# Altium schematic sheet AudioControlSystem.SchDoc
size 406 x 241 mm; SheetNumber: 1; SheetTotal: 7
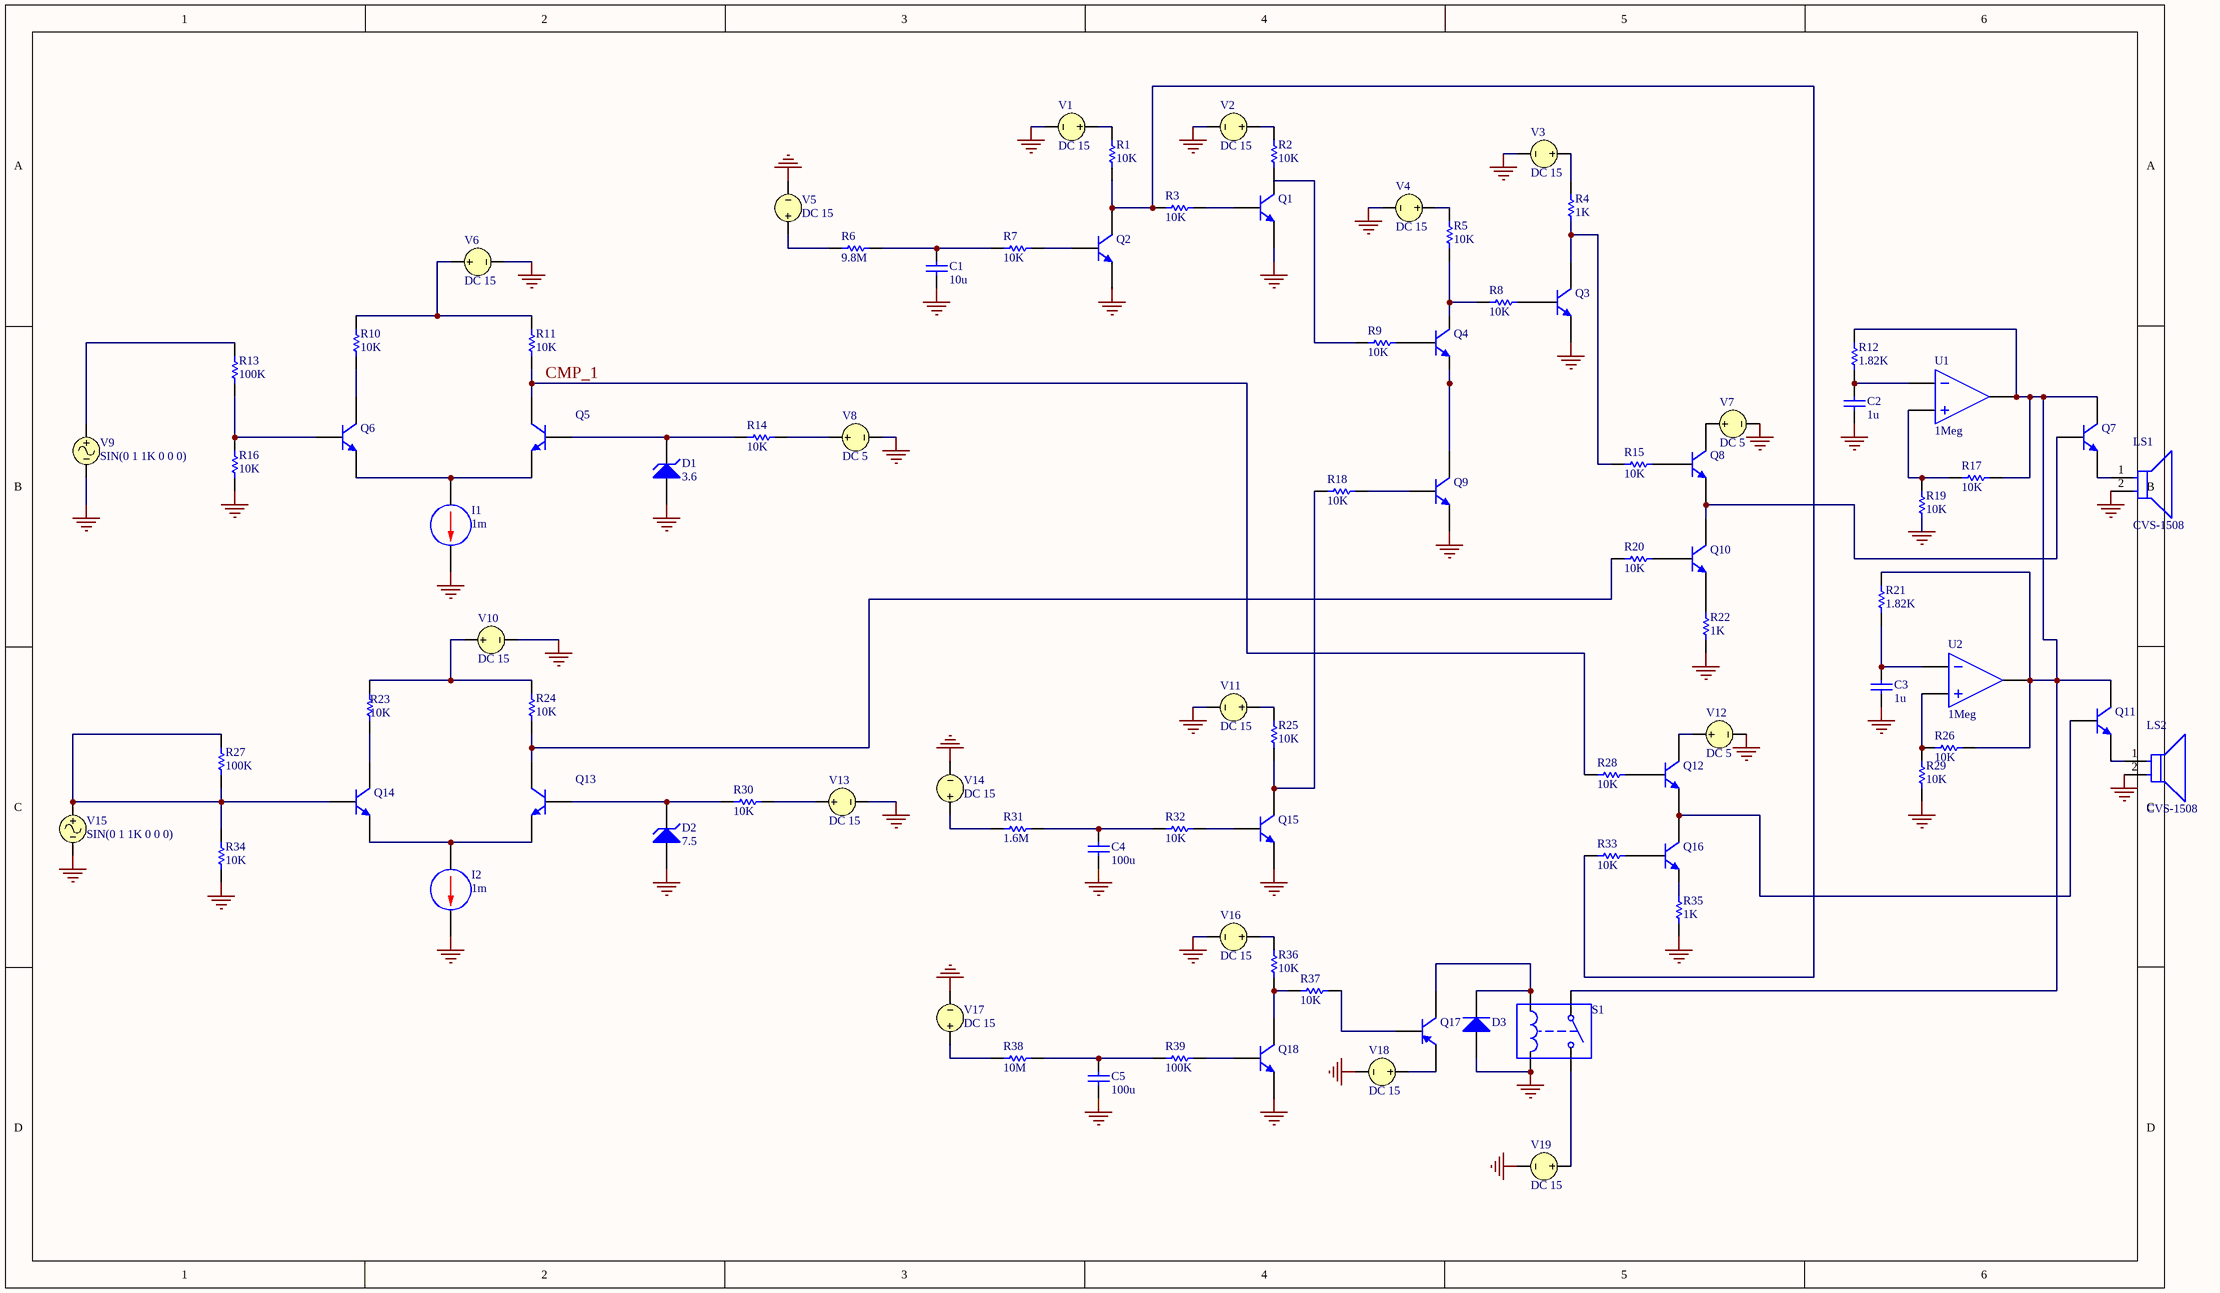
[diagram p0: AudioControlSystem.SchDoc]

## Parts
C1  value 10u  (hidden comment: Capacitor)
C2  value 1u  (hidden comment: Capacitor)
C3  value 1u  (hidden comment: Capacitor)
C4  value 100u  (hidden comment: Capacitor)
C5  value 100u  (hidden comment: Capacitor)
D1  BV: 3.6  (hidden comment: Zener Diode)
D2  BV: 7.5  (hidden comment: Zener Diode)
D3  Diode  (value not drawn)
I1  DC: 1m  (hidden comment: DC Current Source)
I2  DC: 1m  (hidden comment: DC Current Source)
LS1  CVS-1508  [FP-CVS-1508-MFG]
LS2  CVS-1508  [FP-CVS-1508-MFG]
Q1  Bipolar NPN 3 Pins Transistor VBIC Model  (value not drawn)
Q2  Bipolar NPN 3 Pins Transistor VBIC Model  (value not drawn)
Q3  Bipolar NPN 3 Pins Transistor VBIC Model  (value not drawn)
Q4  Bipolar NPN 3 Pins Transistor Gummel-Poon Model  (value not drawn)
Q5  Bipolar NPN 3 Pins Transistor Modified Version of the Gummel-Poon Model  (value not drawn)
Q6  Bipolar NPN 3 Pins Transistor Modified Version of the Gummel-Poon Model  (value not drawn)
Q7  Bipolar NPN 3 Pins Transistor VBIC Model  (value not drawn)
Q8  Bipolar NPN 3 Pins Transistor VBIC Model  (value not drawn)
Q9  Bipolar NPN 3 Pins Transistor Gummel-Poon Model  (value not drawn)
Q10  Bipolar NPN 3 Pins Transistor VBIC Model  (value not drawn)
Q11  Bipolar NPN 3 Pins Transistor VBIC Model  (value not drawn)
Q12  Bipolar NPN 3 Pins Transistor VBIC Model  (value not drawn)
Q13  Bipolar NPN 3 Pins Transistor Modified Version of the Gummel-Poon Model  (value not drawn)
Q14  Bipolar NPN 3 Pins Transistor Modified Version of the Gummel-Poon Model  (value not drawn)
Q15  Bipolar NPN 3 Pins Transistor VBIC Model  (value not drawn)
Q16  Bipolar NPN 3 Pins Transistor VBIC Model  (value not drawn)
Q17  Bipolar PNP 3 Pins Transistor VBIC Model  (value not drawn)
Q18  Bipolar NPN 3 Pins Transistor VBIC Model  (value not drawn)
R1  value 10K  (hidden comment: Resistor)
R2  value 10K  (hidden comment: Resistor)
R3  value 10K  (hidden comment: Resistor)
R4  value 1K  (hidden comment: Resistor)
R5  value 10K  (hidden comment: Resistor)
R6  value 9.8M  (hidden comment: Resistor)
R7  value 10K  (hidden comment: Resistor)
R8  value 10K  (hidden comment: Resistor)
R9  value 10K  (hidden comment: Resistor)
R10  value 10K  (hidden comment: Resistor)
R11  value 10K  (hidden comment: Resistor)
R12  value 1.82K  (hidden comment: Resistor)
R13  value 100K  (hidden comment: Resistor)
R14  value 10K  (hidden comment: Resistor)
R15  value 10K  (hidden comment: Resistor)
R16  value 10K  (hidden comment: Resistor)
R17  value 10K  (hidden comment: Resistor)
R18  value 10K  (hidden comment: Resistor)
R19  value 10K  (hidden comment: Resistor)
R20  value 10K  (hidden comment: Resistor)
R21  value 1.82K  (hidden comment: Resistor)
R22  value 1K  (hidden comment: Resistor)
R23  value 10K  (hidden comment: Resistor)
R24  value 10K  (hidden comment: Resistor)
R25  value 10K  (hidden comment: Resistor)
R26  value 10K  (hidden comment: Resistor)
R27  value 100K  (hidden comment: Resistor)
R28  value 10K  (hidden comment: Resistor)
R29  value 10K  (hidden comment: Resistor)
R30  value 10K  (hidden comment: Resistor)
R31  value 1.6M  (hidden comment: Resistor)
R32  value 10K  (hidden comment: Resistor)
R33  value 10K  (hidden comment: Resistor)
R34  value 10K  (hidden comment: Resistor)
R35  value 1K  (hidden comment: Resistor)
R36  value 10K  (hidden comment: Resistor)
R37  value 10K  (hidden comment: Resistor)
R38  value 10M  (hidden comment: Resistor)
R39  value 100K  (hidden comment: Resistor)
S1  Single-Pole, Single-Throw Normally Opened Relay  (value not drawn)
U1  GAIN: 1Meg  (hidden comment: Ideal Operational Amplifier)
U2  GAIN: 1Meg  (hidden comment: Ideal Operational Amplifier)
V1  DC 15
V2  DC 15
V3  DC 15
V4  DC 15
V5  DC 15
V6  DC 15
V7  DC 5
V8  DC 5
V9  SIN(0 1 1K 0 0 0)
V10  DC 15
V11  DC 15
V12  DC 5
V13  DC 15
V14  DC 15
V15  SIN(0 1 1K 0 0 0)
V16  DC 15
V17  DC 15
V18  DC 15
V19  DC 15

## Nets
GND: C1.1 C2.1 C3.1 C4.1 C5.1 D1.1(A) D2.1(A) D3.1(A) I1.1(+) I2.1(+) LS1.2(A) LS2.2(A) Q1.3(E) Q2.3(E) Q3.3(E) Q9.3(E) Q15.3(E) Q18.3(E) R16.1 R19.1 R22.1 R29.1 R34.1 R35.1 S1.4 V1.2 V2.2 V3.2 V4.2 V5.2 V6.2 V7.2 V8.2 V9.2 V10.2 V11.2 V12.2 V13.2 V14.2 V15.2 V16.2 V17.2 V18.2 V19.2
CMP_1: Q5.1(C) R11.1 R28.1
NetC1_2: C1.2 R6.2 R7.1
NetC2_2: C2.2 R12.1 U1.1(IN-)
NetC3_2: C3.2 R21.1 U2.1(IN-)
NetC4_2: C4.2 R31.2 R32.1
NetC5_2: C5.2 R38.2 R39.1
NetD1_2: D1.2(K) Q5.2(B) R14.1
NetD2_2: D2.2(K) Q13.2(B) R30.1
NetD3_2: D3.2(K) Q17.1(C) S1.3
NetI1_2: I1.2(-) Q5.3(E) Q6.3(E)
NetI2_2: I2.2(-) Q13.3(E) Q14.3(E)
NetLS1_1: LS1.1(C) Q7.3(E)
NetLS2_1: LS2.1(C) Q11.3(E)
NetQ1_2: Q1.2(B) R3.2
NetQ2_1: Q2.1(C) R1.1 R3.1 R33.1
NetQ2_2: Q2.2(B) R7.2
NetQ3_1: Q3.1(C) R4.1 R15.1
NetQ3_2: Q3.2(B) R8.2
NetQ4_1: Q4.1(C) R5.1 R8.1
NetQ4_2: Q4.2(B) R9.2
NetQ4_3: Q4.3(E) Q9.1(C)
NetQ6_1: Q6.1(C) R10.1
NetQ6_2: Q6.2(B) R13.1 R16.2
NetQ7_1: Q7.1(C) Q11.1(C) R12.2 R17.1 R21.2 R26.1 S1.1 U1.3(OUT) U2.3(OUT)
NetQ7_2: Q7.2(B) Q8.3(E) Q10.1(C)
NetQ8_1: Q8.1(C) V7.1
NetQ8_2: Q8.2(B) R15.2
NetQ9_2: Q9.2(B) R18.2
NetQ10_2: Q10.2(B) R20.2
NetQ10_3: Q10.3(E) R22.2
NetQ11_2: Q11.2(B) Q12.3(E) Q16.1(C)
NetQ12_1: Q12.1(C) V12.1
NetQ12_2: Q12.2(B) R28.2
NetQ13_1: Q13.1(C) R20.1 R24.1
NetQ14_1: Q14.1(C) R23.1
NetQ14_2: Q14.2(B) R27.1 R27.2 R34.2 V15.1
NetQ15_1: Q15.1(C) R18.1 R25.1
NetQ15_2: Q15.2(B) R32.2
NetQ16_2: Q16.2(B) R33.2
NetQ16_3: Q16.3(E) R35.2
NetQ17_2: Q17.2(B) R37.2
NetQ17_3: Q17.3(E) V18.1
NetQ18_1: Q18.1(C) R36.1 R37.1
NetQ18_2: Q18.2(B) R39.2
NetR1_2: R1.2 V1.1
NetR2_1: R2.1 R9.1
NetR2_2: R2.2 V2.1
NetR4_2: R4.2 V3.1
NetR5_2: R5.2 V4.1
NetR6_1: R6.1 V5.1
NetR10_2: R10.2 R11.2 V6.1
NetR13_2: R13.2 V9.1
NetR14_2: R14.2 V8.1
NetR17_2: R17.2 R19.2 U1.2(IN+)
NetR23_2: R23.2 R24.2 V10.1
NetR25_2: R25.2 V11.1
NetR26_2: R26.2 R29.2 U2.2(IN+)
NetR30_2: R30.2 V13.1
NetR31_1: R31.1 V14.1
NetR36_2: R36.2 V16.1
NetR38_1: R38.1 V17.1
NetS1_2: S1.2 V19.1

Not connected (* = marked no-connect by the designer): Q1 1(C)

## Library data of the parts
C1-C5 = Capacitor: SimulationGenericComponent: True
D1 D2 = Zener Diode: AF: 1; BV_MAX: 1e99; CJO: 0; EG: 1.11; FC: 0.5; IBV: 0.001; IS: 1e-14; MJSW: 0.33; NTUN: 30; TNOM: 27; XTI: 3; SimulationGenericComponent: True; CJP: 0; CTA: 0; CTP: 0; FCS: 0.5; FV_MAX: 1e99; IKF: 0; IKR: 0; ISR: 1e-14; JSW: 0; JTUN: 0; JTUNSW: 0; KEG: 1; KF: 0; LEVEL: 1; N: 1; NBV: 1; NR: 1; NS: 1; PHP: 1; RS: 0; TCV: 0; TLEV: 0; TLEVC: 0; TM1: 0; TM2: 0; TPB: 0; TPHP: 0; TRS: 0; TRS2: 0; TT: 0; TTT1: 0; TTT2: 0; VJ: 1; XTITUN: 3
D3 = Diode: AF: 1; BV: 0; BV_MAX: 1e99; EG: 1.11; FC: 0.5; IBV: 0.001; ISR: 1e-14; MJSW: 0.33; NTUN: 30; TNOM: 27; XTI: 3; SimulationGenericComponent: True; CJO: 0; CJP: 0; CTA: 0; CTP: 0; FCS: 0.5; FV_MAX: 1e99; IKF: 0; IKR: 0; JSW: 0; JTUN: 0; JTUNSW: 0; KEG: 1; KF: 0; LEVEL: 1; N: 1; NBV: 1; NR: 1; NS: 1; PHP: 1; RS: 0; TCV: 0; TLEV: 0; TLEVC: 0; TM1: 0; TM2: 0; TPB: 0; TPHP: 0; TRS: 0; TRS2: 0; TT: 0; TTT1: 0; TTT2: 0; VJ: 1; XTITUN: 3; IS: 1e-14
I1 I2 = DC Current Source: SimulationGenericComponent: True
LS1 LS2 = CMP-14846-000001-1: SPEAKER 8OHM 300MW TOP PORT 87DB; Manufacturer: CUI Inc; Resistance: 8Ω; Value: 8Ω; Frequency: 1700Hz; Description: CVS Seies 15 mm round 7.5 mm deep Mylar 300 mW 8 Ohm 1.7 kHz PCB mount Speaker; Package: CVS-1508; Device Class L1: Electromechanical; Manufacturer Part Number: CVS-1508; Mouser Description: Speakers & Transducers Speakers; Temperature Range High: +55°C; Octopart: https://octopart.com/cvs-1508-cui-21325683; Device Class L2: Audio Products; Temperature Range Low: -20°C; Category: Speak; Digikey Description: SPEAKER 8OHM 300MW TOP PORT 87DB; Temperature: -20°C to +55°C; Height: 8mm; ComponentLink2Description: Datasheet; ComponentLink2URL: https://www.cui.com/product/resource/cvs-1508.pdf; Device Class L3: Speakers; Lead Free: Yes; RoHS: TRUE; Automotive: No
Q1-Q3 Q7 Q8 Q10-Q12 Q15 Q16 Q18 = BJT NPN VBIC: SimulationGenericComponent: True; AFN: 1; AJC: -0.5; ART: 0.1; AVC1: 0; EA: 1.12; FC: 0.9; IBBE: 1e-06; IBCI: 1e-16; IBEI: 1e-18; MC: 0.33; NCN: 2; NKF: 0.5; PC: 0.75; TNOM: 27; VERS: 1.2; XII: 3; AJE: -0.5; AJS: -0.5; AVC2: 0; BFN: 1; CBCO: 0; CBEO: 0; CCSO: 0; CJC: 0; CJCP: 0; CJE: 0; CJEP: 0; CTH: 0; DEAR: 0; EAIC: 1.12; EAIE: 1.12; EAIS: 1.12; EANC: 1.12; EANE: 1.12; EANS: 1.12; EAP: 1.12; EBBE: 0; GAMM: 0; HRCF: 1; IBCIP: 0; IBCN: 0; IBCNP: 0; IBEIP: 0; IBEN: 0; IBENP: 0; IKF: 0; IKP: 0; IKR: 0; IS: 1e-16; ISP: 0; ISRR: 1; ITF: 0; KFN: 0; ME: 0.33; MS: 0.33; NBBE: 1; NCI: 1; NCIP: 1; NCNP: 2; NEI: 1; NEN: 2; NF: 1; NFP: 1; NR: 1; PE: 0.75; PS: 0.75; QBM: 0; QCO: 0; QTF: 0; RBI: 0.1; RBP: 0.1; RBX: 0; RCI: 0.1; RCX: 0; RE: 0; RS: 0; RTH: 0; TAVC: 0; TD: 0; TF: 0; TNBBE: 0; TNF: 0; TR: 0; TVBBE1: 0; TVBBE2: 0; VBBE: 0; VEF: 0; VER: 0; VO: 0; VREF: 0; VRT: 0; VTF: 0; WBE: 1; WSP: 1; XIKF: 0; XIN: 3; XIS: 3; XISR: 0; XRBI: 0; XRBP: 0; XRBX: 0; XRCI: 0; XRCX: 0; XRE: 0; XRS: 0; XTF: 0; XVO: 0
Q4 Q9 = BJT NPN_GP: SimulationGenericComponent: True; BF: 100; AF: 0; BR: 1; EG: 1.11; FC: 0.5; IS: 1e-16; MJC: 0.33; NC: 2; NE: 1.5; TNOM: 27; VBC_MAX: 1e99; VJC: 0.75; XTI: 3; CJC: 0; CJE: 0; CJS: 0; CTC: 0; CTE: 0; CTS: 0; IKF: 0; IKR: 0; IRB: 0; ISC: 0; ISE: 0; ISS: 0; ITF: 0; KF: 0; MJE: 0.33; MJS: 0; NF: 1; NKF: 0.5; NR: 1; NS: 1; PTF: 0; RB: 0; RBM: 0; RC: 0; RE: 0; SUBS: 1; TBF1: 0; TBF2: 0; TBR1: 0; TBR2: 0; TF: 0; TIKF1: 0; TIKF2: 0; TIKR1: 0; TIKR2: 0; TIRB1: 0; TIRB2: 0; TIS1: 0; TIS2: 0; TISC1: 0; TISC2: 0; TISE1: 0; TISE2: 0; TITF1: 0; TITF2: 0; TLEV: 0; TLEVC: 0; TMJC1: 0; TMJC2: 0; TMJE1: 0; TMJE2: 0; TMJS1: 0; TMJS2: 0; TNC1: 0; TNC2: 0; TNE1: 0; TNE2: 0; TNF1: 0; TNF2: 0; TNR1: 0; TNR2: 0; TNS1: 0; TNS2: 0; TR: 0; TRB1: 0; TRB2: 0; TRC1: 0; TRC2: 0; TRE1: 0; TRE2: 0; TRM1: 0; TRM2: 0; TTF1: 0; TTF2: 0; TTR1: 0; TTR2: 0; TVAF1: 0; TVAF2: 0; TVAR1: 0; TVAR2: 0; TVJC: 0; TVJE: 0; TVJS: 0; VAF: 0; VAR: 0; VBE_MAX: 1e99; VCE_MAX: 1e99; VJE: 0.75; VJS: 0.75; VTF: 0; XCJC: 1; XTB: 0; XTF: 0
Q5 Q6 Q13 Q14 = BJT NPN_MGP: BF: 100; AF: 0; BR: 1; EG: 1.11; FC: 0.5; IS: 1e-16; MJC: 0.33; NC: 2; NE: 1.5; TNOM: 27; VBC_MAX: 1e99; VJC: 0.75; XTI: 3; SimulationGenericComponent: True; CJC: 0; CJE: 0; CJS: 0; CTC: 0; CTE: 0; CTS: 0; IKF: 0; IKR: 0; IRB: 0; ISC: 0; ISE: 0; ISS: 0; ITF: 0; KF: 0; MJE: 0.33; MJS: 0; NF: 1; NKF: 0.5; NR: 1; NS: 1; PTF: 0; RB: 0; RBM: 0; RC: 0; RE: 0; SUBS: 1; TBF1: 0; TBF2: 0; TBR1: 0; TBR2: 0; TF: 0; TIKF1: 0; TIKF2: 0; TIKR1: 0; TIKR2: 0; TIRB1: 0; TIRB2: 0; TIS1: 0; TIS2: 0; TISC1: 0; TISC2: 0; TISE1: 0; TISE2: 0; TITF1: 0; TITF2: 0; TLEV: 0; TLEVC: 0; TMJC1: 0; TMJC2: 0; TMJE1: 0; TMJE2: 0; TMJS1: 0; TMJS2: 0; TNC1: 0; TNC2: 0; TNE1: 0; TNE2: 0; TNF1: 0; TNF2: 0; TNR1: 0; TNR2: 0; TNS1: 0; TNS2: 0; TR: 0; TRB1: 0; TRB2: 0; TRC1: 0; TRC2: 0; TRE1: 0; TRE2: 0; TRM1: 0; TRM2: 0; TTF1: 0; TTF2: 0; TTR1: 0; TTR2: 0; TVAF1: 0; TVAF2: 0; TVAR1: 0; TVAR2: 0; TVJC: 0; TVJE: 0; TVJS: 0; VAF: 0; VAR: 0; VBE_MAX: 1e99; VCE_MAX: 1e99; VJE: 0.75; VJS: 0.75; VTF: 0; XCJC: 1; XTB: 0; XTF: 0
Q17 = BJT PNP VBIC: AFN: 1; AJC: -0.5; ART: 0.1; AVC1: 0; EA: 1.12; FC: 0.9; IBBE: 1e-06; IBCI: 1e-16; IBEI: 1e-18; MC: 0.33; NCN: 2; NKF: 0.5; PC: 0.75; TNOM: 27; VERS: 1.2; XII: 3; SimulationGenericComponent: True; AJE: -0.5; AJS: -0.5; AVC2: 0; BFN: 1; CBCO: 0; CBEO: 0; CCSO: 0; CJC: 0; CJCP: 0; CJE: 0; CJEP: 0; CTH: 0; DEAR: 0; EAIC: 1.12; EAIE: 1.12; EAIS: 1.12; EANC: 1.12; EANE: 1.12; EANS: 1.12; EAP: 1.12; EBBE: 0; GAMM: 0; HRCF: 1; IBCIP: 0; IBCN: 0; IBCNP: 0; IBEIP: 0; IBEN: 0; IBENP: 0; IKF: 0; IKP: 0; IKR: 0; IS: 1e-16; ISP: 0; ISRR: 1; ITF: 0; KFN: 0; ME: 0.33; MS: 0.33; NBBE: 1; NCI: 1; NCIP: 1; NCNP: 2; NEI: 1; NEN: 2; NF: 1; NFP: 1; NR: 1; PE: 0.75; PS: 0.75; QBM: 0; QCO: 0; QTF: 0; RBI: 0.1; RBP: 0.1; RBX: 0; RCI: 0.1; RCX: 0; RE: 0; RS: 0; RTH: 0; TAVC: 0; TD: 0; TF: 0; TNBBE: 0; TNF: 0; TR: 0; TVBBE1: 0; TVBBE2: 0; VBBE: 0; VEF: 0; VER: 0; VO: 0; VREF: 0; VRT: 0; VTF: 0; WBE: 1; WSP: 1; XIKF: 0; XIN: 3; XIS: 3; XISR: 0; XRBI: 0; XRBP: 0; XRBX: 0; XRCI: 0; XRCX: 0; XRE: 0; XRS: 0; XTF: 0; XVO: 0
R1-R39 = Resistor: TC1: 0; SimulationGenericComponent: True; TC2: 0
S1 = SPST Relay NO: L_C: 1u; R_C: 100; RON: 1; ROFF: 1e12; ION: 1m; IOFF: 0; SimulationGenericComponent: True
U1 U2 = OpAmp: SimulationGenericComponent: True
V1-V6 V8 V10 V11 V13 V14 V16-V19 = VSRC: Voltage Source; Note: PCB Footprint - Not required; AC Magnitude: 1; AC Phase: 0; Value: 15; Published: 8-Jun-2000; LatestRevisionDate: 17-Jul-2002; LatestRevisionNote: Re-released for DXP Platform.; PackageReference: Not Applicable; Publisher: Altium Limited
V7 V12 = VSRC: Voltage Source; Note: PCB Footprint - Not required; AC Magnitude: 1; AC Phase: 0; Value: 5; Published: 8-Jun-2000; LatestRevisionDate: 17-Jul-2002; LatestRevisionNote: Re-released for DXP Platform.; PackageReference: Not Applicable; Publisher: Altium Limited
V9 V15 = VSIN: Sinusoidal Voltage Source; Note: PCB Footprint - Not required; Offset: 0; Amplitude: 1; Published: 8-Jun-2000; LatestRevisionDate: 15-Nov-2004; LatestRevisionNote: Corrected Netlist.; PackageReference: Not Applicable; Publisher: Altium Limited; Frequency: 1K; Delay: 0; Damping Factor: 0; Phase: 0; DC Magnitude: 0; AC Magnitude: 1; AC Phase: 0